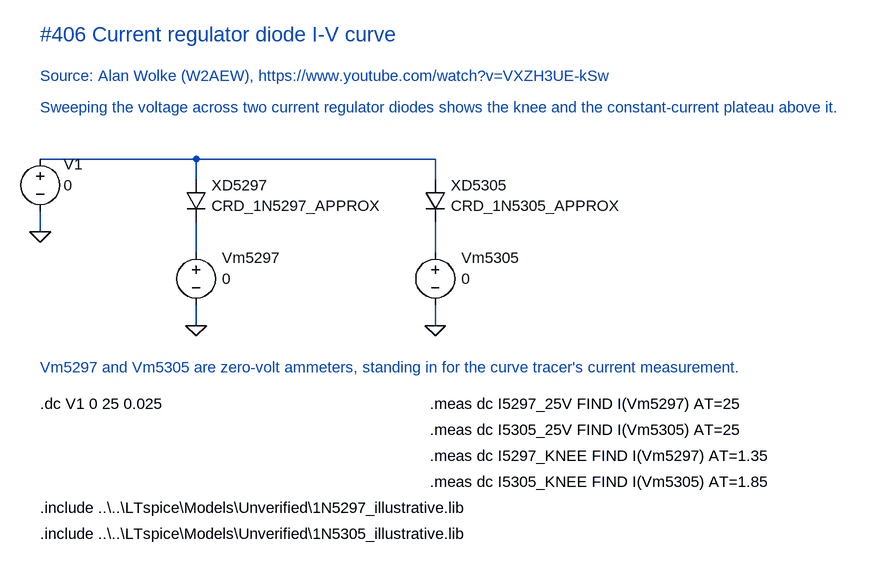
[diagram p0: schematic Current regulator diode I-V curve.asc]
Current regulator diode I-V curve.asc, the LTspice schematic file:
Version 4.1
SHEET 1 1300 900
WIRE 320 240 80 240
WIRE 688 240 320 240
WIRE 320 272 320 240
WIRE 688 272 688 240
WIRE 320 384 320 336
WIRE 688 384 688 336
WIRE 80 352 80 320
WIRE 320 496 320 464
WIRE 688 496 688 464
FLAG 80 352 0
FLAG 320 496 0
FLAG 688 496 0
SYMBOL voltage 80 224 R0
WINDOW 0 36 24 Left 2
WINDOW 3 36 56 Left 2
SYMATTR InstName V1
SYMATTR Value 0
SYMBOL diode 304 272 R0
WINDOW 0 40 8 Left 2
WINDOW 3 40 40 Left 2
SYMATTR Prefix X
SYMATTR InstName XD5297
SYMATTR Value CRD_1N5297_APPROX
SYMBOL voltage 320 368 R0
WINDOW 0 40 24 Left 2
WINDOW 3 40 56 Left 2
SYMATTR InstName Vm5297
SYMATTR Value 0
SYMBOL diode 672 272 R0
WINDOW 0 40 8 Left 2
WINDOW 3 40 40 Left 2
SYMATTR Prefix X
SYMATTR InstName XD5305
SYMATTR Value CRD_1N5305_APPROX
SYMBOL voltage 688 368 R0
WINDOW 0 40 24 Left 2
WINDOW 3 40 56 Left 2
SYMATTR InstName Vm5305
SYMATTR Value 0
TEXT 80 48 Left 3 ;#406 Current regulator diode I-V curve
TEXT 80 112 Left 2 ;Source: Alan Wolke (W2AEW), https://www.youtube.com/watch?v=VXZH3UE-kSw
TEXT 80 160 Left 2 ;Sweeping the voltage across two current regulator diodes shows the knee and the constant-current plateau above it.
TEXT 80 560 Left 2 ;Vm5297 and Vm5305 are zero-volt ammeters, standing in for the curve tracer's current measurement.
TEXT 80 616 Left 2 !.dc V1 0 25 0.025
TEXT 80 776 Left 2 !.include ..\..\LTspice\Models\Unverified\1N5297_illustrative.lib
TEXT 80 816 Left 2 !.include ..\..\LTspice\Models\Unverified\1N5305_illustrative.lib
TEXT 680 616 Left 2 !.meas dc I5297_25V FIND I(Vm5297) AT=25
TEXT 680 656 Left 2 !.meas dc I5305_25V FIND I(Vm5305) AT=25
TEXT 680 696 Left 2 !.meas dc I5297_KNEE FIND I(Vm5297) AT=1.35
TEXT 680 736 Left 2 !.meas dc I5305_KNEE FIND I(Vm5305) AT=1.85

The netlist it stands for:
* Current regulator diode I-V curve.asc
V1 N001 0 0
X§XD5297 N001 N002 CRD_1N5297_APPROX  ; pins + -
Vm5297 N002 0 0
X§XD5305 N001 N003 CRD_1N5305_APPROX  ; pins + -
Vm5305 N003 0 0
* #406 Current regulator diode I-V curve
* Source: Alan Wolke (W2AEW), https://www.youtube.com/watch?v=VXZH3UE-kSw
* Sweeping the voltage across two current regulator diodes shows the knee and the constant-current plateau above it.
* Vm5297 and Vm5305 are zero-volt ammeters, standing in for the curve tracer's current measurement.
.dc V1 0 25 0.025
.include ..\..\LTspice\Models\Unverified\1N5297_illustrative.lib
.include ..\..\LTspice\Models\Unverified\1N5305_illustrative.lib
.meas dc I5297_25V FIND I(Vm5297) AT=25
.meas dc I5305_25V FIND I(Vm5305) AT=25
.meas dc I5297_KNEE FIND I(Vm5297) AT=1.35
.meas dc I5305_KNEE FIND I(Vm5305) AT=1.85
.backanno
.end